# Altium project EMG-Arm-ELEC-V2.0.PrjPcb (part 1 of 4)
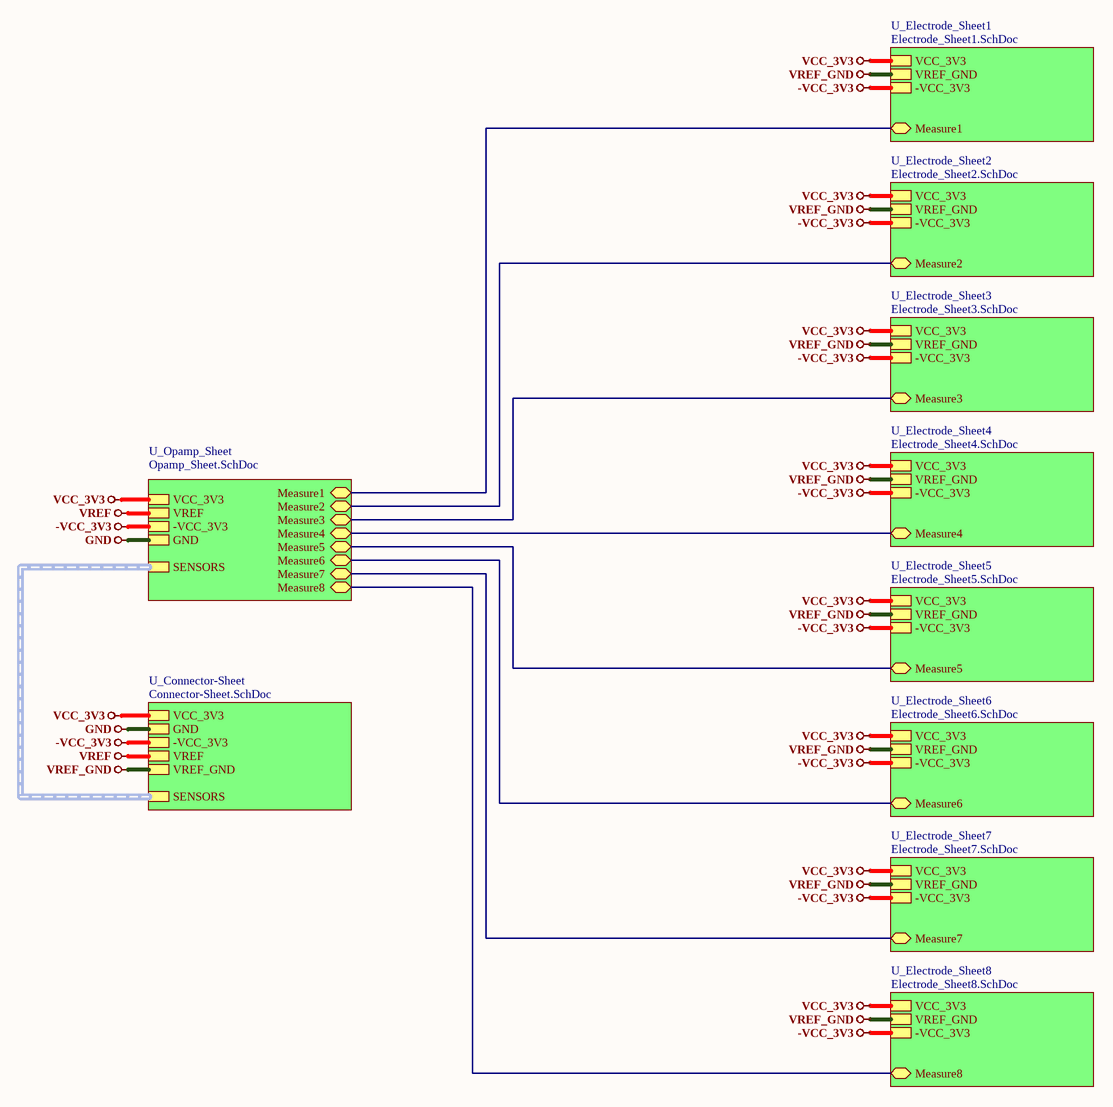
[diagram p0: Top-Sheet.SchDoc]
11 sheets, 263 parts. Net scope: hierarchical (ports join the sheet entries above them; power ports are global).
Board file: EMG-Arm-ELEC-V2.0.PcbDoc
Sheets:
  Top-Sheet.SchDoc
    U_Opamp_Sheet = Opamp_Sheet.SchDoc
    U_Connector-Sheet = Connector-Sheet.SchDoc
    U_Electrode_Sheet1 = Electrode_Sheet1.SchDoc
    U_Electrode_Sheet2 = Electrode_Sheet2.SchDoc
    U_Electrode_Sheet3 = Electrode_Sheet3.SchDoc
    U_Electrode_Sheet4 = Electrode_Sheet4.SchDoc
    U_Electrode_Sheet5 = Electrode_Sheet5.SchDoc
    U_Electrode_Sheet6 = Electrode_Sheet6.SchDoc
    U_Electrode_Sheet7 = Electrode_Sheet7.SchDoc
    U_Electrode_Sheet8 = Electrode_Sheet8.SchDoc

## Sheet Top-Sheet.SchDoc
size 420 x 297 mm

### Sub-sheets
U_Connector-Sheet = Connector-Sheet.SchDoc: SENSORS (harness SENSORS), -VCC_3V3, VCC_3V3, GND, VREF, VREF_GND
U_Electrode_Sheet1 = Electrode_Sheet1.SchDoc: -VCC_3V3, VREF_GND, VCC_3V3, Measure1 (bidir)
U_Electrode_Sheet2 = Electrode_Sheet2.SchDoc: -VCC_3V3, VREF_GND, VCC_3V3, Measure2 (bidir)
U_Electrode_Sheet3 = Electrode_Sheet3.SchDoc: -VCC_3V3, VREF_GND, VCC_3V3, Measure3 (bidir)
U_Electrode_Sheet4 = Electrode_Sheet4.SchDoc: -VCC_3V3, VREF_GND, VCC_3V3, Measure4 (bidir)
U_Electrode_Sheet5 = Electrode_Sheet5.SchDoc: -VCC_3V3, VREF_GND, VCC_3V3, Measure5 (bidir)
U_Electrode_Sheet6 = Electrode_Sheet6.SchDoc: -VCC_3V3, VREF_GND, VCC_3V3, Measure6 (bidir)
U_Electrode_Sheet7 = Electrode_Sheet7.SchDoc: -VCC_3V3, VREF_GND, VCC_3V3, Measure7 (bidir)
U_Electrode_Sheet8 = Electrode_Sheet8.SchDoc: -VCC_3V3, VREF_GND, VCC_3V3, Measure8 (bidir)
U_Opamp_Sheet = Opamp_Sheet.SchDoc: SENSORS (harness SENSORS), -VCC_3V3, VREF, VCC_3V3, GND, Measure1 (bidir), Measure2 (bidir), Measure3 (bidir), Measure4 (bidir), Measure5 (bidir), Measure6 (bidir), Measure7 (bidir), Measure8 (bidir)

### Nets
-VCC_3V3: sheet U_Opamp_Sheet/-VCC_3V3, sheet U_Connector-Sheet/-VCC_3V3, sheet U_Electrode_Sheet1/-VCC_3V3, sheet U_Electrode_Sheet2/-VCC_3V3, sheet U_Electrode_Sheet3/-VCC_3V3, sheet U_Electrode_Sheet4/-VCC_3V3, sheet U_Electrode_Sheet5/-VCC_3V3, sheet U_Electrode_Sheet6/-VCC_3V3, sheet U_Electrode_Sheet7/-VCC_3V3, sheet U_Electrode_Sheet8/-VCC_3V3
GND: sheet U_Opamp_Sheet/GND, sheet U_Connector-Sheet/GND
VCC_3V3: sheet U_Opamp_Sheet/VCC_3V3, sheet U_Connector-Sheet/VCC_3V3, sheet U_Electrode_Sheet1/VCC_3V3, sheet U_Electrode_Sheet2/VCC_3V3, sheet U_Electrode_Sheet3/VCC_3V3, sheet U_Electrode_Sheet4/VCC_3V3, sheet U_Electrode_Sheet5/VCC_3V3, sheet U_Electrode_Sheet6/VCC_3V3, sheet U_Electrode_Sheet7/VCC_3V3, sheet U_Electrode_Sheet8/VCC_3V3
VREF: sheet U_Opamp_Sheet/VREF, sheet U_Connector-Sheet/VREF
VREF_GND: sheet U_Connector-Sheet/VREF_GND, sheet U_Electrode_Sheet1/VREF_GND, sheet U_Electrode_Sheet2/VREF_GND, sheet U_Electrode_Sheet3/VREF_GND, sheet U_Electrode_Sheet4/VREF_GND, sheet U_Electrode_Sheet5/VREF_GND, sheet U_Electrode_Sheet6/VREF_GND, sheet U_Electrode_Sheet7/VREF_GND, sheet U_Electrode_Sheet8/VREF_GND
Measure1: sheet U_Opamp_Sheet/Measure1, sheet U_Electrode_Sheet1/Measure1
Measure2: sheet U_Opamp_Sheet/Measure2, sheet U_Electrode_Sheet2/Measure2
Measure3: sheet U_Opamp_Sheet/Measure3, sheet U_Electrode_Sheet3/Measure3
Measure4: sheet U_Opamp_Sheet/Measure4, sheet U_Electrode_Sheet4/Measure4
Measure5: sheet U_Opamp_Sheet/Measure5, sheet U_Electrode_Sheet5/Measure5
Measure6: sheet U_Opamp_Sheet/Measure6, sheet U_Electrode_Sheet6/Measure6
Measure7: sheet U_Opamp_Sheet/Measure7, sheet U_Electrode_Sheet7/Measure7
Measure8: sheet U_Opamp_Sheet/Measure8, sheet U_Electrode_Sheet8/Measure8

### Buses and harness runs
harness sheet U_Connector-Sheet/SENSORS = sheet U_Opamp_Sheet/SENSORS

### Notes on the sheet
- File:
- Title:
- Date:
- Page
- Num:
- Total:
- Drawn By: Huzaifa Ali

## Sheet Opamp_Sheet.SchDoc
size 420 x 297 mm
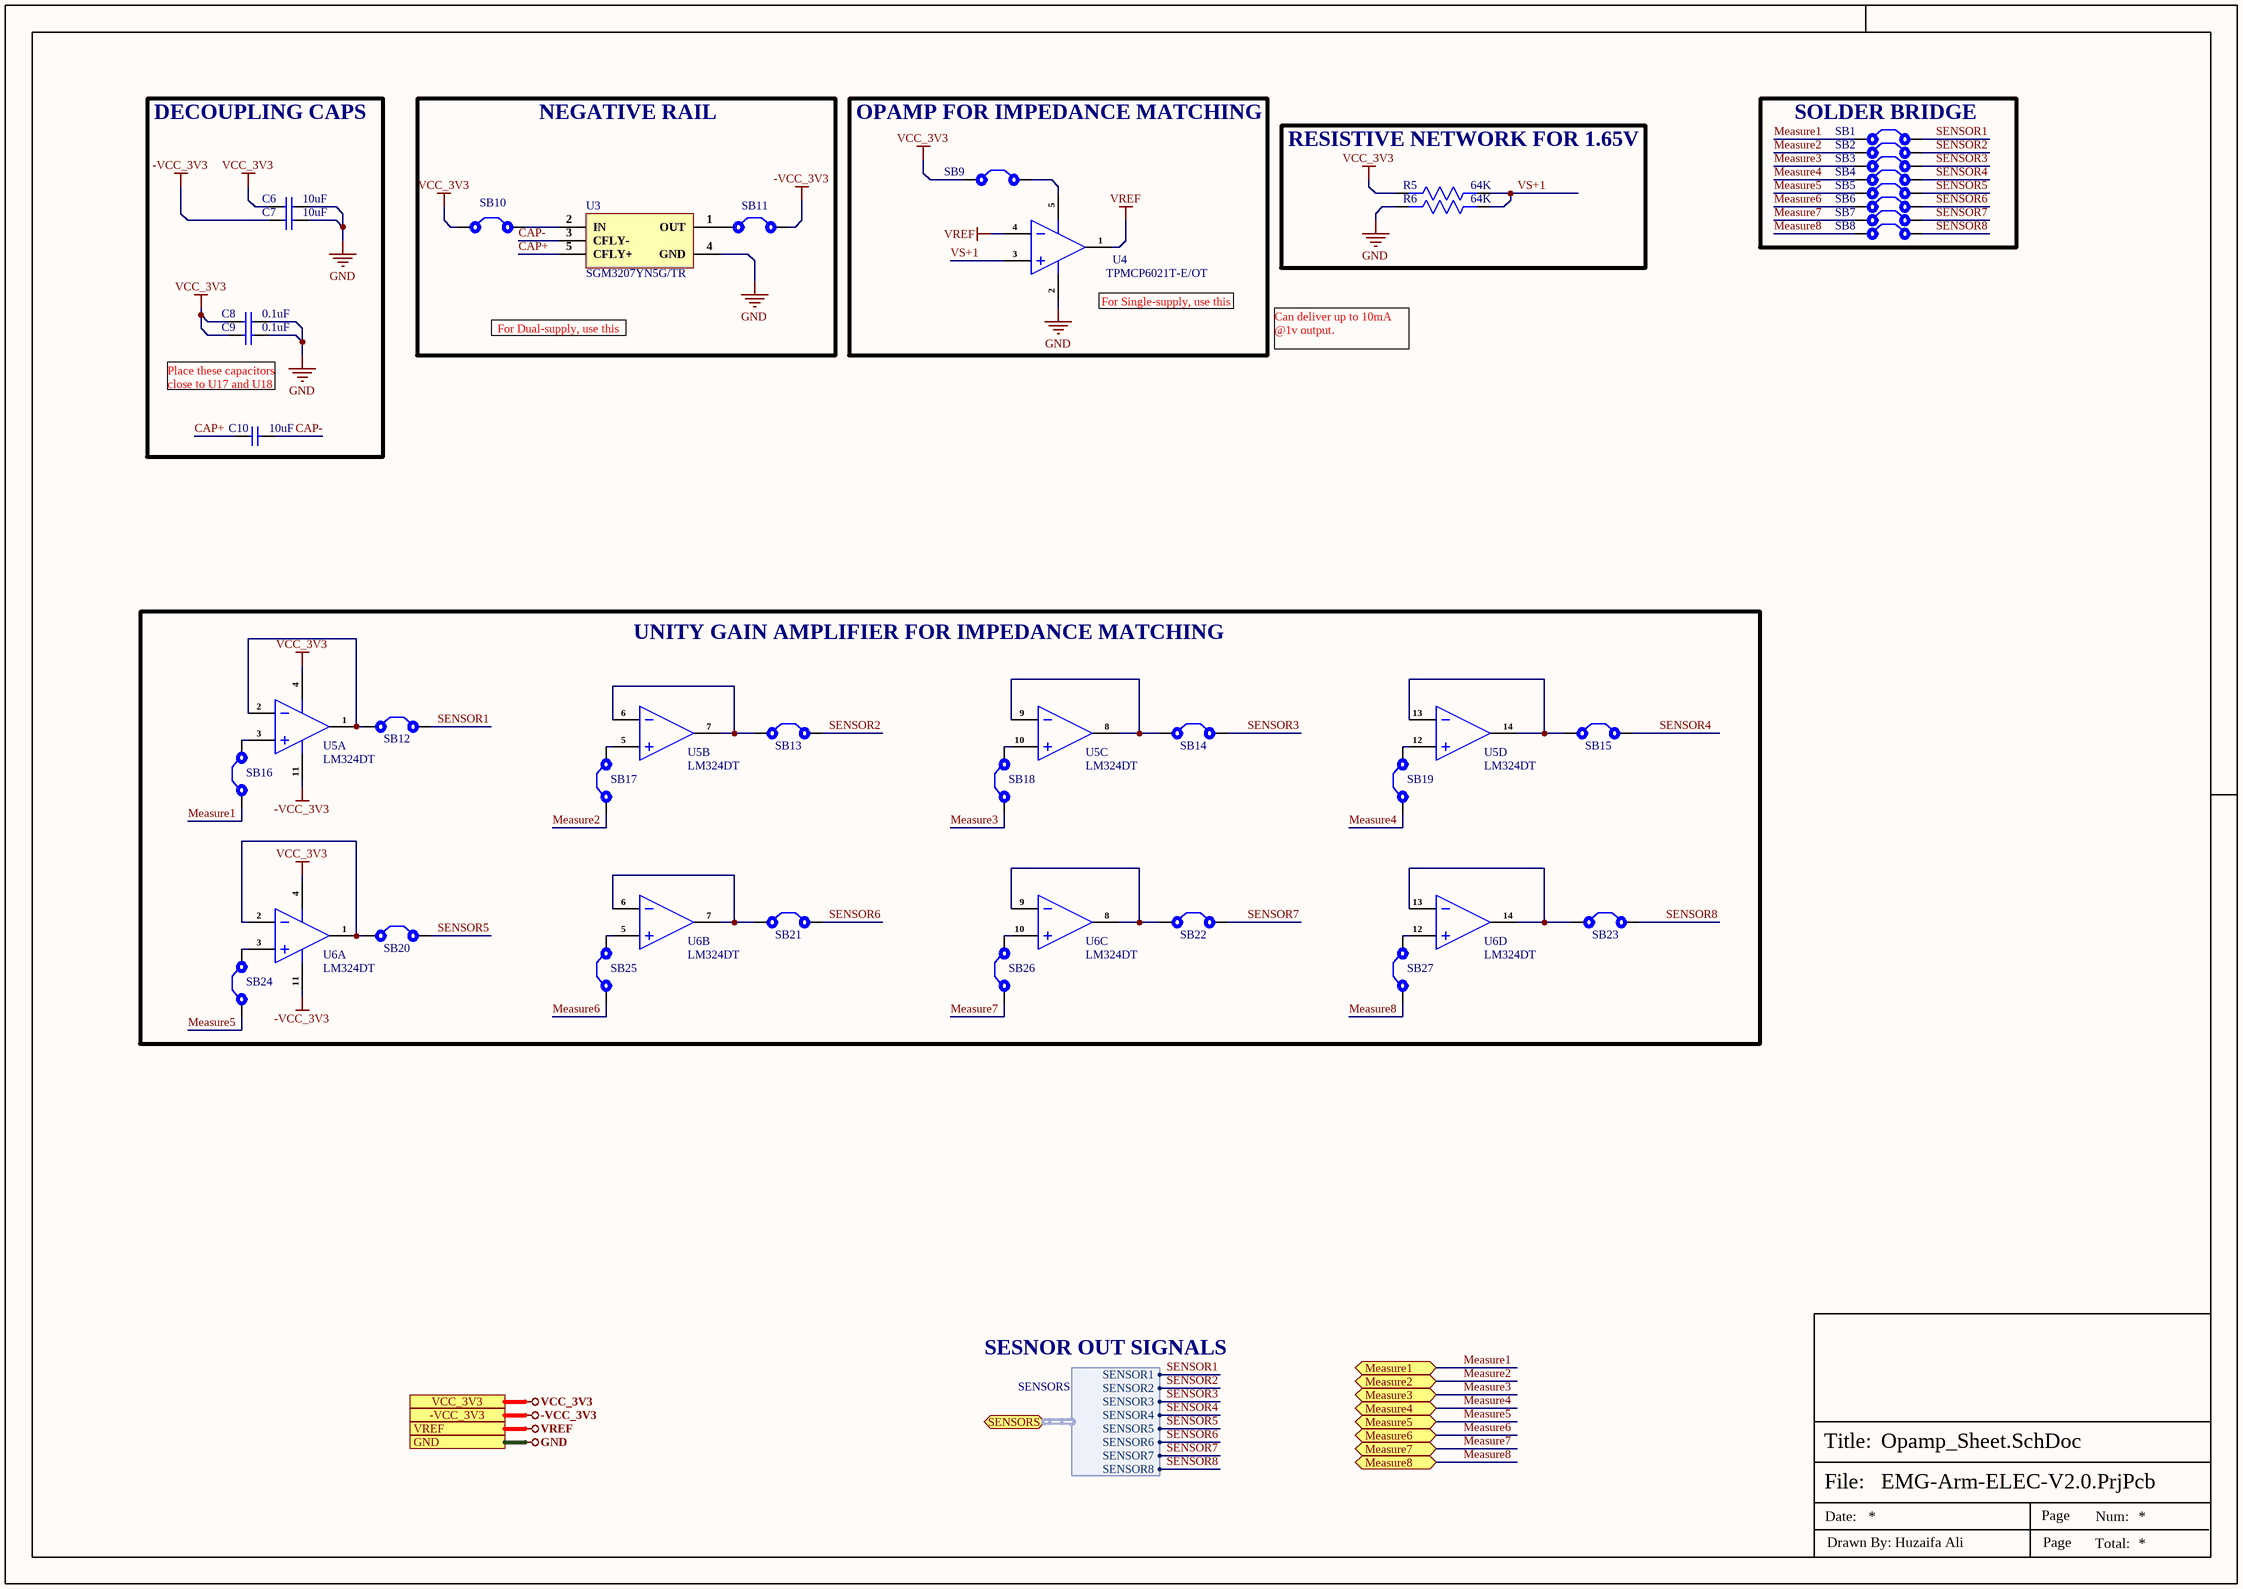
[diagram p1: Opamp_Sheet.SchDoc]

### Parts
C6  10uF  [Cap-0603]
C7  10uF  [Cap-0603]
C8  0.1uF  [Cap-0402]
C9  0.1uF  [Cap-0402]
C10  10uF  [Cap-0603]
R5  64K  [Res-0603]
R6  64K  [Res-0603]
SB1  Solder Bridge 0402  [Solder Bridge 0402]  (value not drawn)  (no BOM)
SB2  Solder Bridge 0402  [Solder Bridge 0402]  (value not drawn)  (no BOM)
SB3  Solder Bridge 0402  [Solder Bridge 0402]  (value not drawn)  (no BOM)
SB4  Solder Bridge 0402  [Solder Bridge 0402]  (value not drawn)  (no BOM)
SB5  Solder Bridge 0402  [Solder Bridge 0402]  (value not drawn)  (no BOM)
SB6  Solder Bridge 0402  [Solder Bridge 0402]  (value not drawn)  (no BOM)
SB7  Solder Bridge 0402  [Solder Bridge 0402]  (value not drawn)  (no BOM)
SB8  Solder Bridge 0402  [Solder Bridge 0402]  (value not drawn)  (no BOM)
SB9  Solder Bridge 0402  [Solder Bridge 0402]  (value not drawn)  (no BOM)
SB10  Solder Bridge 0402  [Solder Bridge 0402]  (value not drawn)  (no BOM)
SB11  Solder Bridge 0402  [Solder Bridge 0402]  (value not drawn)  (no BOM)
SB12  Solder Bridge 0402  [Solder Bridge 0402]  (value not drawn)  (no BOM)
SB13  Solder Bridge 0402  [Solder Bridge 0402]  (value not drawn)  (no BOM)
SB14  Solder Bridge 0402  [Solder Bridge 0402]  (value not drawn)  (no BOM)
SB15  Solder Bridge 0402  [Solder Bridge 0402]  (value not drawn)  (no BOM)
SB16  Solder Bridge 0402  [Solder Bridge 0402]  (value not drawn)  (no BOM)
SB17  Solder Bridge 0402  [Solder Bridge 0402]  (value not drawn)  (no BOM)
SB18  Solder Bridge 0402  [Solder Bridge 0402]  (value not drawn)  (no BOM)
SB19  Solder Bridge 0402  [Solder Bridge 0402]  (value not drawn)  (no BOM)
SB20  Solder Bridge 0402  [Solder Bridge 0402]  (value not drawn)  (no BOM)
SB21  Solder Bridge 0402  [Solder Bridge 0402]  (value not drawn)  (no BOM)
SB22  Solder Bridge 0402  [Solder Bridge 0402]  (value not drawn)  (no BOM)
SB23  Solder Bridge 0402  [Solder Bridge 0402]  (value not drawn)  (no BOM)
SB24  Solder Bridge 0402  [Solder Bridge 0402]  (value not drawn)  (no BOM)
SB25  Solder Bridge 0402  [Solder Bridge 0402]  (value not drawn)  (no BOM)
SB26  Solder Bridge 0402  [Solder Bridge 0402]  (value not drawn)  (no BOM)
SB27  Solder Bridge 0402  [Solder Bridge 0402]  (value not drawn)  (no BOM)
U3  SGM3207YN5G/TR  [SOT-23-5]
U4  TPMCP6021T-E/OT  [SOT-23-5]
U5  LM324DT  [14-SO]  (parts A,B,C,D of 4)
U6  LM324DT  [14-SO]  (parts A,B,C,D of 4)

### Blocks framed on the sheet
DECOUPLING CAPS: C6-C10
NEGATIVE RAIL: SB10 SB11 U3
OPAMP FOR IMPEDANCE MATCHING: SB9 U4
SOLDER BRIDGE: SB1-SB8
RESISTIVE NETWORK FOR 1.65V: R5 R6
UNITY GAIN AMPLIFIER FOR IMPEDANCE MATCHING: SB12-SB27 U5 U6

### Ports
-VCC_3V3, GND, Measure1 (bidir), Measure2 (bidir), Measure3 (bidir), Measure4 (bidir), Measure5 (bidir), Measure6 (bidir), Measure7 (bidir), Measure8 (bidir), SENSORS (bidir, harness SENSORS), VCC_3V3, VREF

### Harnesses
SENSORS: SENSOR1, SENSOR2, SENSOR3, SENSOR4, SENSOR5, SENSOR6, SENSOR7, SENSOR8

### Nets
-VCC_3V3: C7.1 SB11.2 U5.11(VCC-) U6.11(VCC-) ; port -VCC_3V3
GND: C6.2 C7.2 C8.2 C9.2 R6.2 U3.4(GND) U4.2(V-) ; port GND
VCC_3V3: C6.1 C8.1 C9.1 R5.2 SB9.1 SB10.1 U5.4(VCC+) U6.4(VCC+) ; port VCC_3V3
VREF: U4.1(OUT) U4.4(IN-) ; port VREF
CAP+: C10.1 U3.5(CFLY+)
CAP-: C10.2 U3.3(CFLY-)
Measure1: SB1.1 SB16.1 ; port Measure1
Measure2: SB2.1 SB17.1 ; port Measure2
Measure3: SB3.1 SB18.1 ; port Measure3
Measure4: SB4.1 SB19.1 ; port Measure4
Measure5: SB5.1 SB24.1 ; port Measure5
Measure6: SB6.1 SB25.1 ; port Measure6
Measure7: SB7.1 SB26.1 ; port Measure7
Measure8: SB8.1 SB27.1 ; port Measure8
SENSOR1: SB1.2 SB12.2 ; port SENSORS.SENSOR1
SENSOR2: SB2.2 SB13.2 ; port SENSORS.SENSOR2
SENSOR3: SB3.2 SB14.2 ; port SENSORS.SENSOR3
SENSOR4: SB4.2 SB15.2 ; port SENSORS.SENSOR4
SENSOR5: SB5.2 SB20.2 ; port SENSORS.SENSOR5
SENSOR6: SB6.2 SB21.2 ; port SENSORS.SENSOR6
SENSOR7: SB7.2 SB22.2 ; port SENSORS.SENSOR7
SENSOR8: SB8.2 SB23.2 ; port SENSORS.SENSOR8
VS+1: R5.1 R6.1 U4.3(IN+)
NetSB9_2: SB9.2 U4.5(V+)
NetSB10_2: SB10.2 U3.2(IN)
NetSB11_1: SB11.1 U3.1(OUT)
NetSB12_1: SB12.1 U5.1(1OUT) U5.2(IN-)
NetSB13_1: SB13.1 U5.6(2IN-) U5.7(2OUT)
NetSB14_1: SB14.1 U5.8(3OUT) U5.9(3IN-)
NetSB15_1: SB15.1 U5.13(4IN-) U5.14(4OUT)
NetSB16_2: SB16.2 U5.3(IN+)
NetSB17_2: SB17.2 U5.5(2IN+)
NetSB18_2: SB18.2 U5.10(3IN+)
NetSB19_2: SB19.2 U5.12(4IN+)
NetSB20_1: SB20.1 U6.1(1OUT) U6.2(IN-)
NetSB21_1: SB21.1 U6.6(2IN-) U6.7(2OUT)
NetSB22_1: SB22.1 U6.8(3OUT) U6.9(3IN-)
NetSB23_1: SB23.1 U6.13(4IN-) U6.14(4OUT)
NetSB24_2: SB24.2 U6.3(IN+)
NetSB25_2: SB25.2 U6.5(2IN+)
NetSB26_2: SB26.2 U6.10(3IN+)
NetSB27_2: SB27.2 U6.12(4IN+)

### Notes on the sheet
- (near U4) For Single-supply, use this
- Place these capacitors close to U17 and U18
- For Dual-supply, use this
- Can deliver up to 10mA @1v output.
- SESNOR OUT SIGNALS
- File:
- Title:
- Date:
- Page
- Num:
- Total:
- Drawn By: Huzaifa Ali

### Library data of the parts
C6 C7 C10 = CL10A106MA8NRNC: CAP CER 10UF 25V X5R 0603; Manufacturer: Samsung; Tolerance: 20%; Supplier 1: Avnet; Manufacturer Part Number: CL10A106MA8NRNC; RoHS: Yes; Category: Ceramic Capacitors; Pricing 1: 4000=0.03753, 8000=0.03700, 16000=0.03595, 24000=0.03515, 32000=0.03383, 40000=0.03304, 400000=0.03225 (USD); Mount: Surface Mount; Case/Package: 0603; Case Code (Metric): 1608; Case Code (Imperial): 0603; Contact Plating: Tin; Min Operating Temperature: -55°C; Max Operating Temperature: 85°C; Package Quantity: 1; Packaging: Tape and Reel; Capacitance: 10uF; Voltage Rating: 25V; Dielectric: X5R; Termination: Wraparound; Series: CL; Construction: Flat; Length: 0.063inch; Width: 0.031inch; Thickness: 0.035inch; Lead Free: Lead Free; RoHS Compliant: Yes; ComponentLink1URL: https://datasheet.ciiva.com/25766/cl10a106ma8nrnc-25766562.pdf?src-supplier=Digi-Key; ComponentLink1Description: https://datasheet.ciiva.com/25766/cl10a106ma8nrnc-25766562.pdf?src-supplier=Digi-Key; Supplier Part Number 1: CL10A106MA8NRNC; LCSC Part Number: C96446
C8 C9 = GRM155R71H104ME14D: CAP CER 0.1UF 50V X7R 0402; Manufacturer: Murata; Tolerance: 20%; Capacitance: 100nF; Item Type: Capacitor; Supplier 1: Avnet; Manufacturer Part Number: GRM155R71H104ME14D; Stock 1: 100000; Pricing 1: 10000=0.00444, 20000=0.00420, 40000=0.00396, 60000=0.00372, 80000=0.00348, 100000=0.00324, 1000000=0.00300 (USD); Mount: Surface Mount; Case/Package: 0402; Min Operating Temperature: -55°C; Max Operating Temperature: 125°C; Packaging: Cut Tape; Voltage Rating: 50V; Length: 0.039inch; Width: 0.02inch; Thickness: 0.022inch; ComponentLink1URL: http://www.mouser.com/ds/2/281/c02e-2905.pdf?src-supplier=Mouser; ComponentLink1Description: http://www.mouser.com/ds/2/281/c02e-2905.pdf?src-supplier=Mouser; ComponentLink2URL: http://search.murata.co.jp/Ceramy/image/img/A01X/G101/ENG/GRM155R71H104ME14-01.pdf?src-supplier=Digi-Key; ComponentLink2Description: http://search.murata.co.jp/Ceramy/image/img/A01X/G101/ENG/GRM155R71H104ME14-01.pdf?src-supplier=Digi-Key; ComponentLink3URL: http://psearch.en.murata.com/capacitor/product/GRM155R71H104ME14%23.pdf?src-supplier=Avnet; ComponentLink3Description: http://psearch.en.murata.com/capacitor/product/GRM155R71H104ME14%23.pdf?src-supplier=Avnet; Supplier Part Number 1: GRM155R71H104ME14D; RoHS: Yes; Category: Ceramic Capacitors; RoHS Compliant: Yes; LCSC Part Number: C182412
R5 R6 = ARG03DTC6402N: 1/10W Thin Film Resistor 75V ±0.5% ±25ppm/℃ -55℃~+155℃ 64kΩ 0603 Chip Resistor - Surface Mount ROHS; Manufacturer: iking Tech; Value: 64K; Manufacturer Part Number: ARG03DTC6402N; Footprint: 0603; ComponentLink1Description: LCSC; ComponentLink1URL: https://lcsc.com/product-detail/Chip-Resistor-Surface-Mount_Viking-Tech-ARG03DTC6402N_C2902643.html; LCSC Part Number: C2902643; Item Type: Resistor
SB1-SB27 = Solder Bridge 0402: Solder Bridge ON; Manufacturer Part Number: Solder Bridge 0402; Item Type: Solder Bridge
U3 = SGM3207YN5G/TR: NO Charge pump 1 -5.5V~-1.4V 1.4V~5.5V 60mA 19kHz SOT-23-5 DC-DC Converters ROHS; Manufacturer: SG Micro; Item Type: IC; Supplier 1: Avnet; Manufacturer Part Number: SGM3207YN5G/TR; RoHS: No; Category: Uncategorized; Pricing 1: 3000=0.38750, 6000=0.36250, 12000=0.33750, 18000=0.32500, 24000=0.31250, 30000=0.31250, 300000=0.30500 (USD); LCSC Part Number: C80403; Supplier Part Number 1: SGM3207YN5G/TR
U4 = TPMCP6021T-E/OT: SOT-23-5 Operational Amplifier ROHS; Manufacturer: TECH PUBLIC; Item Type: IC; Manufacturer Part Number: TPMCP6021T-E/OT; LCSC Part Number: C2923365; ComponentLink1Description: LCSC; ComponentLink1URL: https://www.lcsc.com/product-detail/Operational-Amplifier_TECH-PUBLIC-TPMCP6021T-E-OT_C2923365.html
U5 U6 = LM324DT: IC OPAMP GP 1.3MHZ 14SO; Manufacturer: STMicroelectronics; Max Supply Voltage: 30V; Min Supply Voltage: 3V; Min Dual Supply Voltage: 1.5V; Max Dual Supply Voltage: 15V; Voltage Gain: 100dB; Slew Rate: 0.4V/µs; Common Mode Rejection Ratio: 70dB; Nominal Supply Current: 1.2mA; Input Offset Voltage (Vos): 7mV; Input Bias Current: 150nA; Number of Circuits: 4; Output Current per Channel: 40mA; Dual Supply Voltage: 12V; Supply Type: Single,Dual; Input Voltage Noise Density: 40nV/sqrt Hz; Max Power Dissipation: 400mW; Supplier 1: Arrow Electronics; Manufacturer Part Number: LM324DT; RoHS: Yes; LCSC Part Number: C71035; Stock 1: 287500; Pricing 1: 2500=0.18900 (USD); Mount: Surface Mount; Case/Package: SO; Number of Pins: 14; Contact Plating: Tin,Matte; Weight: 0.009143oz; Min Operating Temperature: 0°C; Max Operating Temperature: 70°C; Gain Bandwidth Product: 1.3MHz; Packaging: Cut Tape; Package Quantity: 2500; Operating Supply Current: 1.2mA; Operating Supply Voltage: 15V; Number of Channels: 4; Output Current: 40mA; Number of Elements: 4; Series: LM324; Technology: BIPOLAR; Bandwidth: 1.3MHz; Number of Amplifiers: 4; Unity Gain Bandwidth Product: 1.3MHz; Item Type: IC; Width: 4mm; Height: 1.65mm; Radiation Hardening: No; RoHS Compliant: Yes; Lead Free: Lead Free; REACH SVHC: No SVHC; ComponentLink1URL: https://datasheet.ciiva.com/4758/cd00000457-103203-4758032.pdf?src-supplier=Mouser; ComponentLink1Description: https://datasheet.ciiva.com/4758/cd00000457-103203-4758032.pdf?src-supplier=Mouser; ComponentLink2URL: https://datasheet.ciiva.com/8008/1834360-8008827.pdf?src-supplier=Element14; ComponentLink2Description: https://datasheet.ciiva.com/8008/1834360-8008827.pdf?src-supplier=Element14; ComponentLink3URL: https://datasheet.ciiva.com/8008/1834360-8008490.pdf?src-supplier=Element14; ComponentLink3Description: https://datasheet.ciiva.com/8008/1834360-8008490.pdf?src-supplier=Element14; ComponentLink4URL: https://datasheet.ciiva.com/28630/1834360-28630538.pdf?src-supplier=Element14; ComponentLink4Description: https://datasheet.ciiva.com/28630/1834360-28630538.pdf?src-supplier=Element14; ComponentLink5URL: https://datasheet.ciiva.com/1795/cd00000457-1795560.pdf?src-supplier=Digi-Key; ComponentLink5Description: https://datasheet.ciiva.com/1795/cd00000457-1795560.pdf?src-supplier=Digi-Key; ComponentLink6URL: https://datasheet.ciiva.com/1795/cd00000457-1795559.pdf?src-supplier=Digi-Key; ComponentLink6Description: https://datasheet.ciiva.com/1795/cd00000457-1795559.pdf?src-supplier=Digi-Key; ComponentLink7URL: https://datasheet.ciiva.com/1795/cd00000457-1795561.pdf?src-supplier=Digi-Key; ComponentLink7Description: https://datasheet.ciiva.com/1795/cd00000457-1795561.pdf?src-supplier=Digi-Key; ComponentLink8URL: https://datasheet.ciiva.com/16375/cd00000457-16375528.pdf?src-supplier=Future+Electronics; ComponentLink8Description: https://datasheet.ciiva.com/16375/cd00000457-16375528.pdf?src-supplier=Future+Electronics; Supplier Part Number 1: LM324DT

## Sheet Connector-Sheet.SchDoc
size 420 x 297 mm
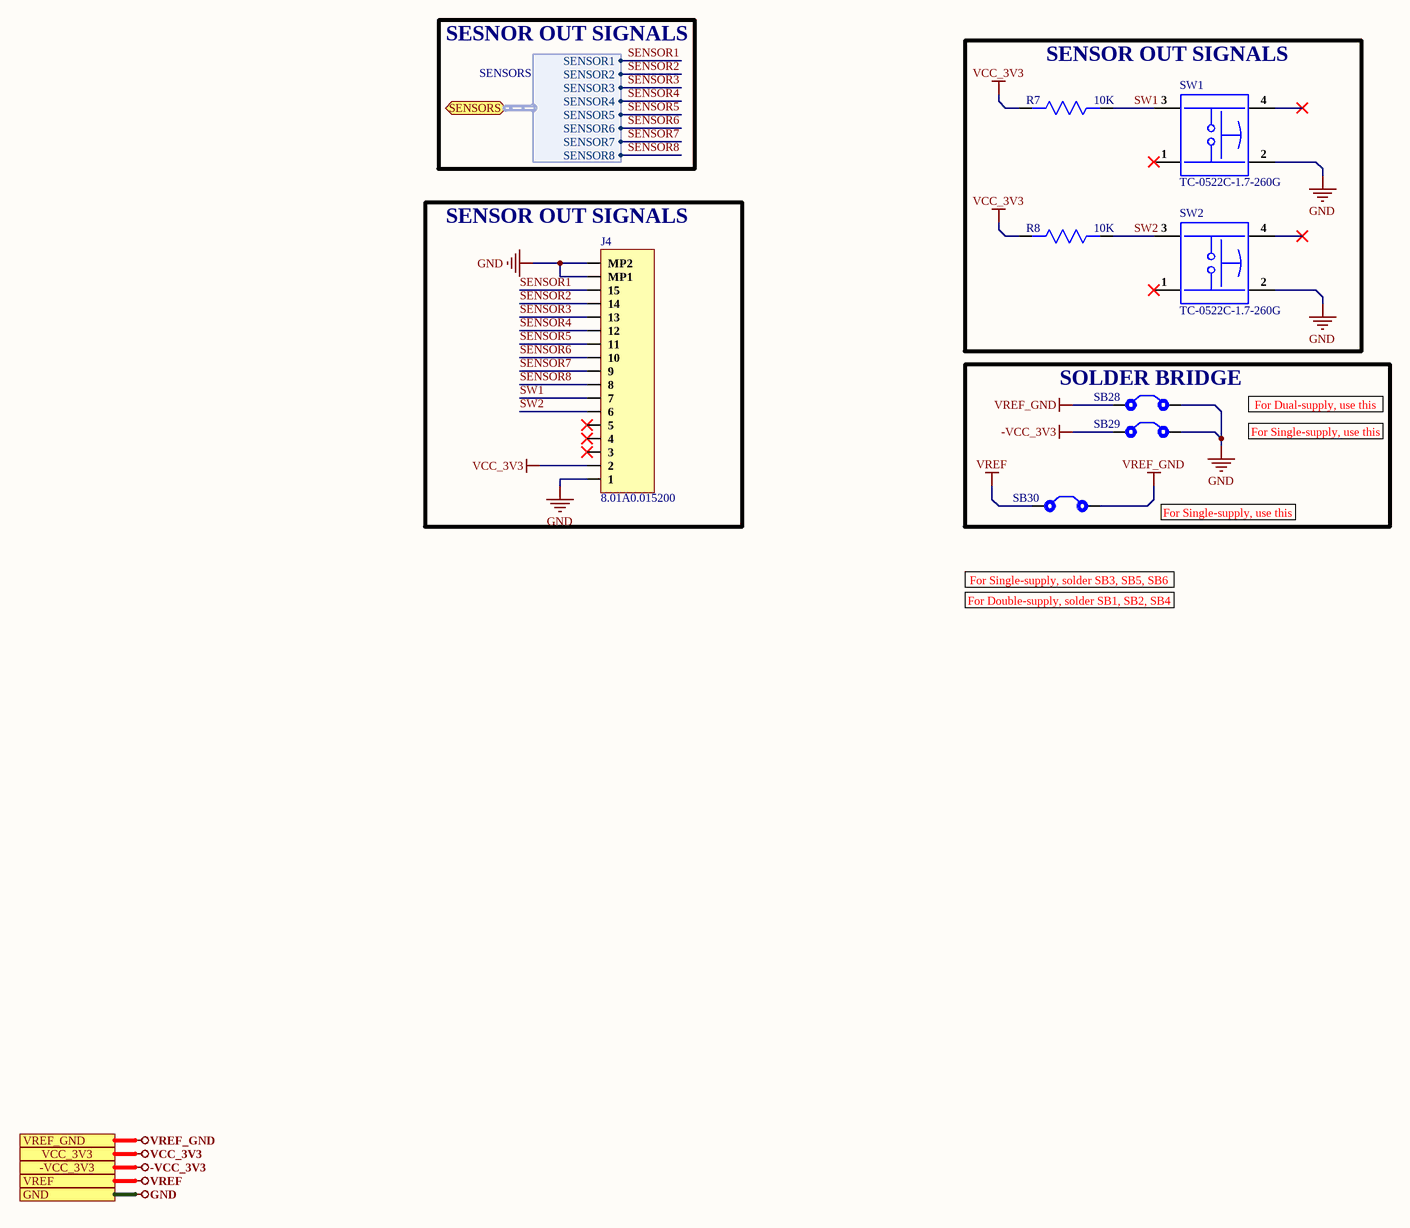
[diagram p2: Connector-Sheet.SchDoc]

### Parts
J4  8.01A0.015200  [8.01A0.015200]
R7  10K  [Res-0402]
R8  10K  [Res-0402]
SB28  Solder Bridge 0402  [Solder Bridge 0402]  (value not drawn)  (no BOM)
SB29  Solder Bridge 0402  [Solder Bridge 0402]  (value not drawn)  (no BOM)
SB30  Solder Bridge 0402  [Solder Bridge 0402]  (value not drawn)  (no BOM)
SW1  TC-0522C-1.7-260G  [TC-0522C-1.7-260G_]
SW2  TC-0522C-1.7-260G  [TC-0522C-1.7-260G_]

### Blocks framed on the sheet
SENSOR OUT SIGNALS: R7 R8 SW1 SW2
SENSOR OUT SIGNALS: J4
SOLDER BRIDGE: SB28-SB30

### Ports
-VCC_3V3, GND, SENSORS (bidir, harness SENSORS), VCC_3V3, VREF, VREF_GND

### Harnesses
SENSORS: SENSOR1, SENSOR2, SENSOR3, SENSOR4, SENSOR5, SENSOR6, SENSOR7, SENSOR8

### Nets
-VCC_3V3: SB29.1 ; port -VCC_3V3
GND: J4.1 J4.MP1 J4.MP2 SB28.2 SB29.2 SW1.2 SW2.2 ; port GND
VCC_3V3: J4.2 R7.2 R8.2 ; port VCC_3V3
VREF: SB30.1 ; port VREF
VREF_GND: SB28.1 SB30.2 ; port VREF_GND
SENSOR1: J4.15 ; port SENSORS.SENSOR1
SENSOR2: J4.14 ; port SENSORS.SENSOR2
SENSOR3: J4.13 ; port SENSORS.SENSOR3
SENSOR4: J4.12 ; port SENSORS.SENSOR4
SENSOR5: J4.11 ; port SENSORS.SENSOR5
SENSOR6: J4.10 ; port SENSORS.SENSOR6
SENSOR7: J4.9 ; port SENSORS.SENSOR7
SENSOR8: J4.8 ; port SENSORS.SENSOR8
SW1: J4.7 R7.1 SW1.3
SW2: J4.6 R8.1 SW2.3

Not connected (* = marked no-connect by the designer): J4 3* 4* 5*; SW1 1* 4*; SW2 1* 4*

### Notes on the sheet
- SESNOR OUT SIGNALS
- For Dual-supply, use this
- For Single-supply, use this
- For Single-supply, solder SB3, SB5, SB6
- For Double-supply, solder SB1, SB2, SB4
- File:
- Title:
- Date:
- Page
- Num:
- Total:
- Drawn By: Huzaifa Ali

### Library data of the parts
J4 = 8.01A0.015200: -40℃~+80℃ 15P Dual-sided contacts / top and bottom connection 0.5mm SMD,P=0.5mm,Surface Mount，Right Angle FFC, FPC (Flat Flexible) Connector Assemblies ROHS; Manufacturer: DIANWEI; Item Type: FFC, FPC Connector; Manufacturer Part Number: 8.01A0.015200; Package: SMD,P=0.5mm,Surface Mount，Right Angle; LCSC Part Number: C19188796; ComponentLink1Description: LCSC; ComponentLink1URL: https://www.lcsc.com/product-detail/FFC-FPC-Flat-Flexible-Connector-Assemblies_DIANWEI-8-01A0-015200_C19188796.html?s_z=n_HC-FPC-05-20-15RLTAG
R7 R8 = RC0402FR-0710KL: RES 10K OHM 1% 1/16W 0402; Manufacturer: Yageo; Resistance: 10kR; Temperature Coefficient: 100ppm/°C; Voltage Rating (DC): 50V; Power Rating: 62.5mW; Max Power Dissipation: 63mW; Supplier 1: Mouser; Manufacturer Part Number: RC0402FR-0710KL; Stock 1: 18648329; Pricing 1: 1=0.10000, 10=0.01400, 50=0.01400, 100=0.00500, 1000=0.00300, 10000=0.00200 (USD); Case/Package: 0402; Number of Pins: 2; Case Code (Imperial): 0402; Case Code (Metric): 1005; Min Operating Temperature: -55°C; Max Operating Temperature: 155°C; Tolerance: 1%; Packaging: Tape and Reel; Voltage Rating: 50V; Termination: SMD/SMT; Military Standard: Not; Working Voltage: 50V; Number of Terminations: 2; Length: 1mm; Height: 0.32mm; Width: 0.5mm; Depth: 0.5mm; Lead Pitch: 0.2mm; REACH SVHC: No SVHC; Lead Free: Lead Free; ComponentLink1URL: https://datasheet.ciiva.com/7660/38568-7660787.pdf?src-supplier=Element14; ComponentLink1Description: https://datasheet.ciiva.com/7660/38568-7660787.pdf?src-supplier=Element14; ComponentLink2URL: https://datasheet.ciiva.com/7849/1686128-7849814.pdf?src-supplier=Element14; ComponentLink2Description: https://datasheet.ciiva.com/7849/1686128-7849814.pdf?src-supplier=Element14; ComponentLink3URL: https://datasheet.ciiva.com/7983/1018594-7983486.pdf?src-supplier=Element14; ComponentLink3Description: https://datasheet.ciiva.com/7983/1018594-7983486.pdf?src-supplier=Element14; ComponentLink4URL: https://datasheet.ciiva.com/22747/1018594-22747512.pdf?src-supplier=Element14; ComponentLink4Description: https://datasheet.ciiva.com/22747/1018594-22747512.pdf?src-supplier=Element14; Supplier Part Number 1: 603-RC0402FR-0710KL; RoHS: Yes; Category: Chip SMD Resistors; Resistor Type: Thick Film; Features: Moisture Resistant; Series: RC; Resistance Tolerance: 1%; Construction: Rectangular; RoHS Compliant: Yes; ComponentLink5URL: https://datasheet.ciiva.com/12667/pyu-rc0402-51-rohs-l-6-r-12667067.pdf?src-supplier=Mouser; ComponentLink5Description: https://datasheet.ciiva.com/12667/pyu-rc0402-51-rohs-l-6-r-12667067.pdf?src-supplier=Mouser; ComponentLink6URL: https://datasheet.ciiva.com/7849/1784430-7849813.pdf?src-supplier=Element14; ComponentLink6Description: https://datasheet.ciiva.com/7849/1784430-7849813.pdf?src-supplier=Element14; ComponentLink7URL: https://datasheet.ciiva.com/7849/1784430-7849815.pdf?src-supplier=Element14; ComponentLink7Description: https://datasheet.ciiva.com/7849/1784430-7849815.pdf?src-supplier=Element14; LCSC Part Number: C60490
SB28-SB30 = Solder Bridge 0402: Solder Bridge ON; Manufacturer Part Number: Solder Bridge 0402; Item Type: Solder Bridge
SW1 SW2 = TC-0522C-1.7-260G: No Gull Wing 50mA 100MΩ 80000 260gf@±50gf 12V -25℃~+85℃ 1.7mm Golden Round Button Brick nogging SPST SMD Tactile Switches ROHS; Manufacturer: HCTL; Item Type: Switch; Manufacturer Part Number: TC-0522C-1.7-260G; Value: -; Footprint: Custom; ComponentLink1Description: LCSC; ComponentLink1URL: https://www.lcsc.com/product-detail/Tactile-Switches_HCTL-TC-0522C-1-7-260G_C2845290.html; LCSC Part Number: C2845290

## Sheet Electrode_Sheet1.SchDoc
size 420 x 297 mm
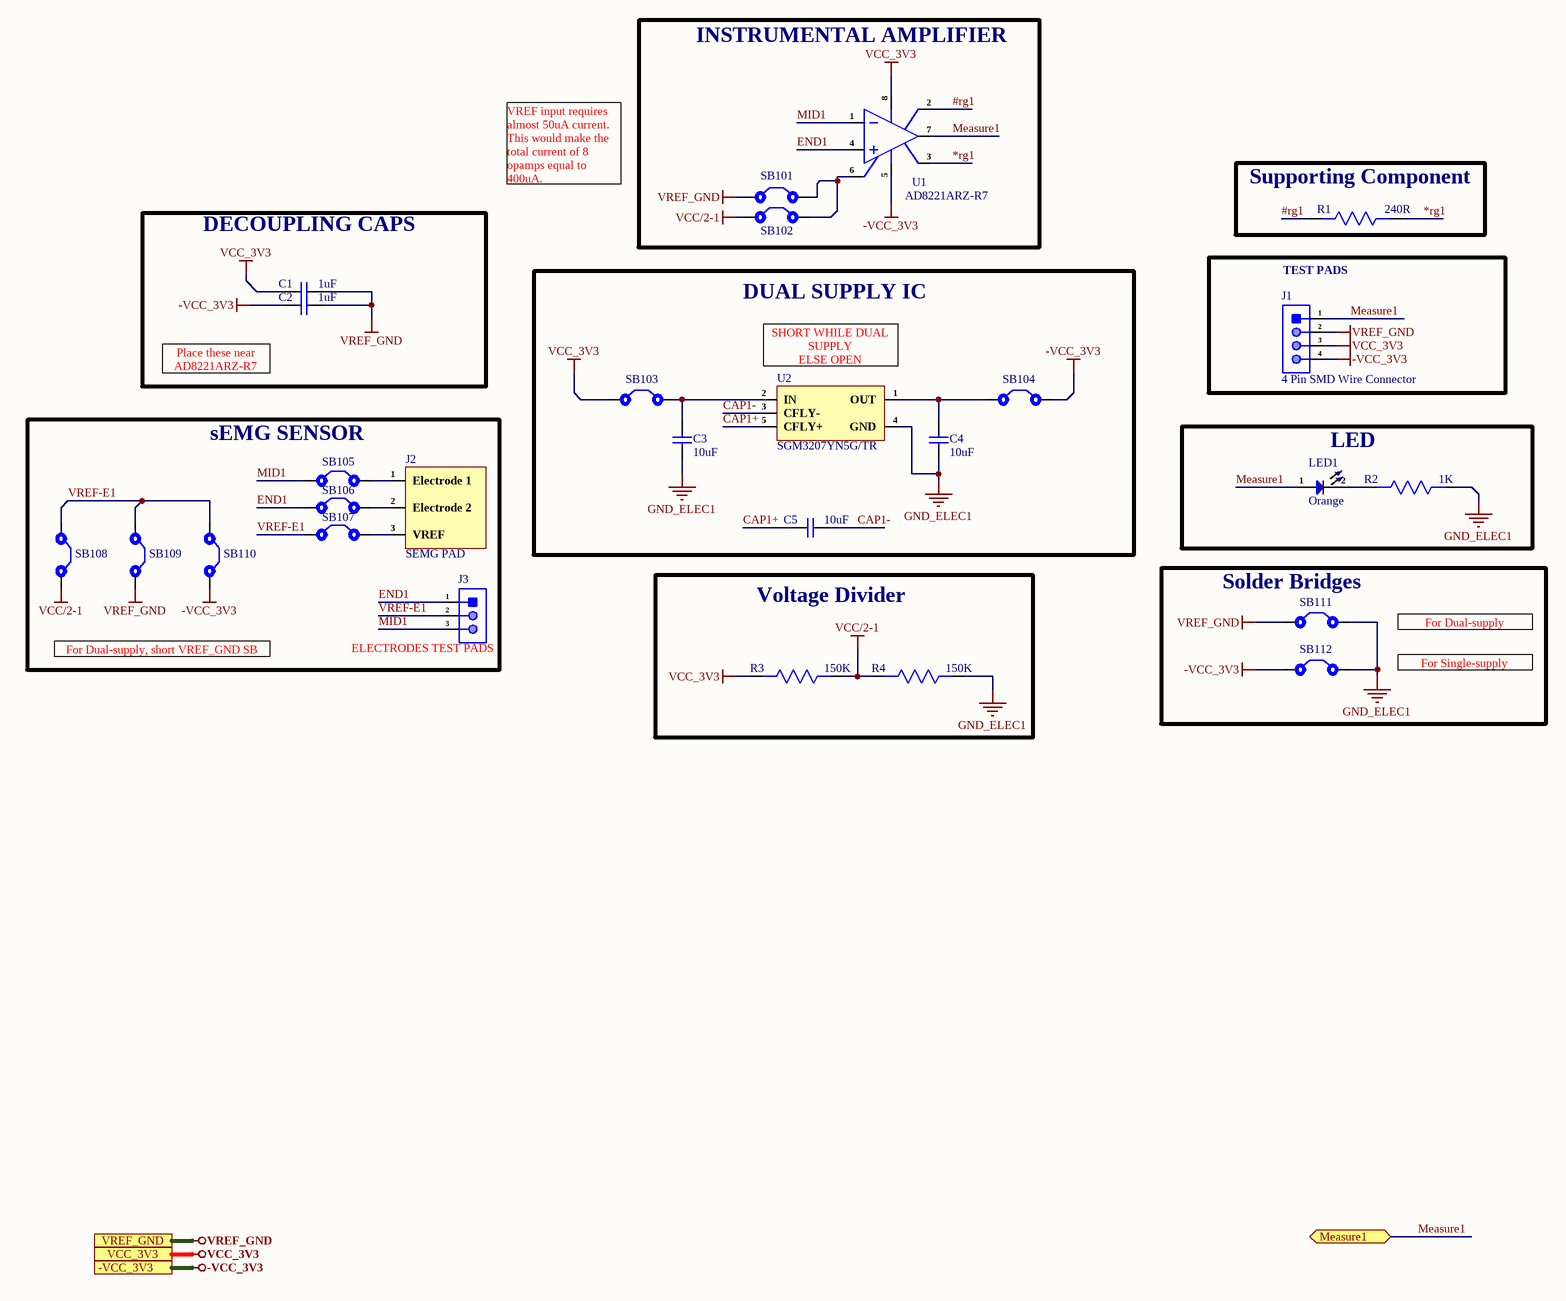
[diagram p3: Electrode_Sheet1.SchDoc]

### Parts
C1  1uF  [Cap-0402]
C2  1uF  [Cap-0402]
C3  10uF  [Cap-0603]
C4  10uF  [Cap-0603]
C5  10uF  [Cap-0603]
J1  4 Pin SMD Wire Connector  [4 Pin SMD Wire CON.]  (no BOM)
J2  SEMG PAD  [SEMG-PAD]
J3  Test Pad SMD 3 Pin  [Test Pad (SMD 3 Pin)]  (value not drawn)  (no BOM)
LED1  Orange  [LED-0603]
R1  240R  [Res-0402]
R2  1K  [Res-0402]
R3  150K  [Res-0402]
R4  150K  [Res-0402]
SB101  Solder Bridge 0402  [Solder Bridge 0402]  (value not drawn)  (no BOM)
SB102  Solder Bridge 0402  [Solder Bridge 0402]  (value not drawn)  (no BOM)
SB103  Solder Bridge 0402  [Solder Bridge 0402]  (value not drawn)  (no BOM)
SB104  Solder Bridge 0402  [Solder Bridge 0402]  (value not drawn)  (no BOM)
SB105  Solder Bridge 0402  [Solder Bridge 0402]  (value not drawn)  (no BOM)
SB106  Solder Bridge 0402  [Solder Bridge 0402]  (value not drawn)  (no BOM)
SB107  Solder Bridge 0402  [Solder Bridge 0402]  (value not drawn)  (no BOM)
SB108  Solder Bridge 0402  [Solder Bridge 0402]  (value not drawn)  (no BOM)
SB109  Solder Bridge 0402  [Solder Bridge 0402]  (value not drawn)  (no BOM)
SB110  Solder Bridge 0402  [Solder Bridge 0402]  (value not drawn)  (no BOM)
SB111  Solder Bridge 0402  [Solder Bridge 0402]  (value not drawn)  (no BOM)
SB112  Solder Bridge 0402  [Solder Bridge 0402]  (value not drawn)  (no BOM)
U1  AD8221ARZ-R7  [SOIC-8]
U2  SGM3207YN5G/TR  [SOT-23-5]

### Blocks framed on the sheet
INSTRUMENTAL AMPLIFIER: SB101 SB102 U1
Supporting Component: R1
DECOUPLING CAPS: C1 C2
TEST PADS: J1
DUAL SUPPLY IC: C3-C5 SB103 SB104 U2
sEMG SENSOR: J2 J3 SB105-SB110
LED: LED1 R2
Voltage Divider: R3 R4
Solder Bridges: SB111 SB112

### Ports
-VCC_3V3, Measure1 (bidir), VCC_3V3, VREF_GND

### Nets
-VCC_3V3: C2.1 J1.4 SB104.2 SB110.2 SB112.1 U1.5(V-) ; port -VCC_3V3
GND_ELEC1: C3.1 C4.1 R2.1 R4.2 SB111.2 SB112.2 U2.4(GND)
VCC/2-1: R3.2 R4.1 SB102.1 SB108.2
VCC_3V3: C1.1 J1.3 R3.1 SB103.1 U1.8(V+) ; port VCC_3V3
VREF_GND: C1.2 C2.2 J1.2 SB101.1 SB109.2 SB111.1 ; port VREF_GND
#rg1: R1.2 U1.2(RG)
*rg1: R1.1 U1.3(RG)
CAP1+: C5.1 U2.5(CFLY+)
CAP1-: C5.2 U2.3(CFLY-)
END1: J3.1 SB106.1 U1.4(IN+)
Measure1: J1.1 LED1.1 U1.7(VOUT) ; port Measure1
MID1: J3.3 SB105.1 U1.1(IN-)
VREF-E1: J3.2 SB107.1 SB108.1 SB109.1 SB110.1
NetC3_2: C3.2 SB103.2 U2.2(IN)
NetC4_2: C4.2 SB104.1 U2.1(OUT)
NetJ2_1: J2.1(Electrode_1) SB105.2
NetJ2_2: J2.2(Electrode_2) SB106.2
NetJ2_3: J2.3(VREF) SB107.2
NetLED1_2: LED1.2 R2.2
NetSB101_2: SB101.2 SB102.2 U1.6(REF)

### Notes on the sheet
- VREF input requires almost 50uA current. This would make the total current of 8 opamps equal to 400uA.
- Place these near AD8221ARZ-R7
- (near U2) SHORT WHILE DUAL SUPPLY
  ELSE OPEN
- For Dual-supply, short VREF_GND SB
- (near J3) ELECTRODES TEST PADS
- For Dual-supply
- For Single-supply
- File:
- Title:
- Date:
- Page
- Num:
- Total:
- Drawn By: Huzaifa Ali

### Library data of the parts
C1 C2 = CC0402KRX5R7BB105: CAP CER 1UF 16V X5R 0402; Manufacturer: Yageo; Tolerance: 10%; Item Type: Capacitor; Supplier 1: Digi-Key; Manufacturer Part Number: CC0402KRX5R7BB105; Stock 1: 1405667; Pricing 1: 1=0.36, 10=0.252, 100=0.1512, 500=0.1134, 1000=0.09576, 2500=0.09072, 5000=0.08568 (USD); Mount: Surface Mount; Case/Package: 0402; Weight: 2.3E-05oz; Case Code (Imperial): 0402; Case Code (Metric): 1005; Min Operating Temperature: -55°C; Max Operating Temperature: 85°C; Capacitance: 1uF; Dielectric: X5R; Packaging: Tape and Reel; Voltage Rating (DC): 16V; Voltage Rating: 16V; Termination: SMD/SMT; Composition: Ceramic; Length: 1mm; Height: 0.5mm; Width: 0.02inch; Thickness: 0.022inch; Depth: 0.5mm; Radiation Hardening: No; Lead Free: Lead Free; Halogen Free: Halogen Free; ComponentLink1URL: http://www.yageo.com/documents/recent/UPY-GPHC_X5R_4V-to-50V_12.pdf?src-supplier=Avnet+Europe; ComponentLink1Description: http://www.yageo.com/documents/recent/UPY-GPHC_X5R_4V-to-50V_12.pdf?src-supplier=Avnet+Europe; Supplier Part Number 1: 311-1691-6-ND; LCSC Part Number: C325464
C3-C5 = CL10A106MA8NRNC: as C6 on sheet Opamp_Sheet; Supplier 1: Avnet; Manufacturer Part Number: CL10A106MA8NRNC; RoHS: Yes; Category: Ceramic Capacitors; Pricing 1: 4000=0.03753, 8000=0.03700, 16000=0.03595, 24000=0.03515, 32000=0.03383, 40000=0.03304, 400000=0.03225 (USD); Mount: Surface Mount; Case/Package: 0603; Case Code (Metric): 1608; Case Code (Imperial): 0603; Contact Plating: Tin; Min Operating Temperature: -55°C; Max Operating Temperature: 85°C; Package Quantity: 1; Packaging: Tape and Reel; Capacitance: 10uF; Voltage Rating: 25V; Dielectric: X5R; Termination: Wraparound; Series: CL; Construction: Flat; Length: 0.063inch; Width: 0.031inch; Thickness: 0.035inch; Lead Free: Lead Free; RoHS Compliant: Yes; ComponentLink1URL: https://datasheet.ciiva.com/25766/cl10a106ma8nrnc-25766562.pdf?src-supplier=Digi-Key; ComponentLink1Description: https://datasheet.ciiva.com/25766/cl10a106ma8nrnc-25766562.pdf?src-supplier=Digi-Key; Supplier Part Number 1: CL10A106MA8NRNC; LCSC Part Number: C96446
J1 = 4 Pin SMD Wire Connector: Wire Connecting Pads; Item Type: SMD Pads; Manufacturer Part Number: 4 Pin SMD Wire Connector
J2 = SEMG PAD: Sensor Connecting Pads
J3 = Test Pad SMD 3 Pin: Test Pad
LED1 = 19-217/S2C-AQ1R1B/3T: 0603(H=0.4mm) λD=600.5~612.5nm VR=5V VF=1.7V~2.2V IF=25mA PD=60mW; Manufacturer: Everlight; Item Type: LED; Supplier 1: Digi-Key; Manufacturer Part Number: 19-217/S2C-AQ1R1B/3T; RoHS: No; Category: LEDs; Supplier Part Number 1: 1080-19-217/S2C-AQ1R1B/3TTR-ND; LCSC Part Number: C146215; ComponentLink1Description: LCSC; ComponentLink1URL: https://www.lcsc.com/product-detail/Light-Emitting-Diodes-LED_Everlight-Elec-19-217-S2C-AQ1R1B-3T_C146215.html
R1 = RC0402FR-07240RL: RES 240 OHM 1% 1/16W 0402; Manufacturer: Yageo; Power Rating: 63mW; Temperature Coefficient: 100ppm/°C; Voltage Rating (DC): 50V; Supplier 1: Mouser; Manufacturer Part Number: RC0402FR-07240RL; RoHS: Yes; Category: Chip SMD Resistors; Stock 1: 1903202; Pricing 1: 1=0.10000, 10=0.01200, 50=0.01200, 100=0.00500, 1000=0.00300, 10000=0.00100 (USD); Case/Package: 0402; Case Code (Metric): 1005; Case Code (Imperial): 0402; Size Code: 0402; Min Operating Temperature: -55°C; Max Operating Temperature: 155°C; Resistance: 240R; Tolerance: 1%; Packaging: Tape and Reel; Resistor Type: Thick Film; Voltage Rating: 50V; Package Quantity: 1; Number of Terminations: 2; Termination: SMD/SMT; Max Power Dissipation: 63mW; Features: Moisture Resistant; Series: RC; Construction: Rectangular; Resistance Tolerance: 1%; Length: 1mm; Width: 0.02inch; Height: 0.016inch; Depth: 0.5mm; REACH SVHC: Unknown; Lead Free: Lead Free; RoHS Compliant: Yes; Military Standard: Not; ComponentLink1URL: https://datasheet.ciiva.com/7849/1018594-7849915.pdf?src-supplier=Element14; ComponentLink1Description: https://datasheet.ciiva.com/7849/1018594-7849915.pdf?src-supplier=Element14; ComponentLink2URL: https://datasheet.ciiva.com/7849/1018594-7849916.pdf?src-supplier=Element14; ComponentLink2Description: https://datasheet.ciiva.com/7849/1018594-7849916.pdf?src-supplier=Element14; ComponentLink3URL: https://datasheet.ciiva.com/2519/pyu-r-int-thick-7-2519157.pdf?src-supplier=Digi-Key; ComponentLink3Description: https://datasheet.ciiva.com/2519/pyu-r-int-thick-7-2519157.pdf?src-supplier=Digi-Key; ComponentLink4URL: https://datasheet.ciiva.com/2519/pyu-r-int-thick-7-2519158.pdf?src-supplier=Digi-Key; ComponentLink4Description: https://datasheet.ciiva.com/2519/pyu-r-int-thick-7-2519158.pdf?src-supplier=Digi-Key; ComponentLink5URL: https://datasheet.ciiva.com/2519/pyu-r-int-thick-7-2519156.pdf?src-supplier=Digi-Key; ComponentLink5Description: https://datasheet.ciiva.com/2519/pyu-r-int-thick-7-2519156.pdf?src-supplier=Digi-Key; ComponentLink6URL: https://datasheet.ciiva.com/12669/pyu-rc0402-51-rohs-l-6-r-12669689.pdf?src-supplier=Mouser; ComponentLink6Description: https://datasheet.ciiva.com/12669/pyu-rc0402-51-rohs-l-6-r-12669689.pdf?src-supplier=Mouser; ComponentLink7URL: https://datasheet.ciiva.com/17419/pyu-rc0402-51-rohs-l-6-r-17419482.pdf?src-supplier=Future+Electronics; ComponentLink7Description: https://datasheet.ciiva.com/17419/pyu-rc0402-51-rohs-l-6-r-17419482.pdf?src-supplier=Future+Electronics; Supplier Part Number 1: 603-RC0402FR-07240RL
R2 = RC0402JR-071KL: RES 1K OHM 5% 1/16W 0402; Manufacturer: Yageo; Resistance: 1kR; Power Rating: 62.5mW; Voltage Rating: 50V; Temperature Coefficient: 100ppm/°C; Max Power Dissipation: 63mW; Item Type: Resistor; Supplier 1: Digi-Key; Manufacturer Part Number: RC0402JR-071KL; RoHS: Yes; Category: Chip SMD Resistors; Stock 1: 452315; Pricing 1: 1=0.10000, 10=0.01300, 100=0.00540, 1000=0.00244, 2500=0.00212, 5000=0.00175 (USD); Case/Package: 0402; Case Code (Imperial): 0402; Case Code (Metric): 1005; Size Code: 0402; Min Operating Temperature: -55°C; Max Operating Temperature: 155°C; Tolerance: 5%; Packaging: Tape and Reel; Package Quantity: 1; Termination: SMD/SMT; Resistor Type: Thick Film; Number of Terminations: 2; Features: Moisture Resistant; Series: RC; Resistance Tolerance: 5%; Construction: Rectangular; Length: 0.039inch; Width: 0.02inch; Height: 0.016inch; Depth: 0.5mm; REACH SVHC: No SVHC; Military Standard: Not; Lead Free: Lead Free; RoHS Compliant: Yes; ComponentLink1URL: https://datasheet.ciiva.com/7983/1018594-7983558.pdf?src-supplier=Element14; ComponentLink1Description: https://datasheet.ciiva.com/7983/1018594-7983558.pdf?src-supplier=Element14; ComponentLink2URL: https://datasheet.ciiva.com/2452/pyu-r-int-thick-7-2452756.pdf?src-supplier=Digi-Key; ComponentLink2Description: https://datasheet.ciiva.com/2452/pyu-r-int-thick-7-2452756.pdf?src-supplier=Digi-Key; ComponentLink3URL: https://datasheet.ciiva.com/2452/pyu-r-int-thick-7-2452757.pdf?src-supplier=Digi-Key; ComponentLink3Description: https://datasheet.ciiva.com/2452/pyu-r-int-thick-7-2452757.pdf?src-supplier=Digi-Key; ComponentLink4URL: https://datasheet.ciiva.com/2452/pyu-r-int-thick-7-2452755.pdf?src-supplier=Digi-Key; ComponentLink4Description: https://datasheet.ciiva.com/2452/pyu-r-int-thick-7-2452755.pdf?src-supplier=Digi-Key; ComponentLink5URL: https://datasheet.ciiva.com/7850/1018594-7850170.pdf?src-supplier=Element14; ComponentLink5Description: https://datasheet.ciiva.com/7850/1018594-7850170.pdf?src-supplier=Element14; ComponentLink6URL: https://datasheet.ciiva.com/7850/1018594-7850171.pdf?src-supplier=Element14; ComponentLink6Description: https://datasheet.ciiva.com/7850/1018594-7850171.pdf?src-supplier=Element14; ComponentLink7URL: https://datasheet.ciiva.com/17081/pyu-rc0402-51-rohs-l-6-r-17081438.pdf?src-supplier=Future+Electronics; ComponentLink7Description: https://datasheet.ciiva.com/17081/pyu-rc0402-51-rohs-l-6-r-17081438.pdf?src-supplier=Future+Electronics; Supplier Part Number 1: 311-1.0KJRCT-ND; LCSC Part Number: C105637
R3 R4 = RC0402JR-07150KL: RES SMD 0402 150kOhm 5% Paper T/R; Manufacturer: Yageo; Resistance: 150kR; Power Rating: 63mW; Voltage Rating: 50V; Temperature Coefficient: 100ppm/°C; Item Type: Resistor; Supplier 1: Arrow Electronics; Manufacturer Part Number: RC0402JR-07150KL; RoHS: Yes; Category: Chip SMD Resistors; Stock 1: 170000; Pricing 1: 10000=0.00100 (USD); Case/Package: 0402; Case Code (Metric): 1005; Case Code (Imperial): 0402; Weight: 2.3E-05oz; Size Code: 0402; Min Operating Temperature: -55°C; Max Operating Temperature: 155°C; Package Quantity: 1; Tolerance: 5%; Packaging: Tape and Reel; Resistor Type: Thick Film; Number of Terminations: 2; Termination: SMD/SMT; Max Power Dissipation: 63mW; Features: Moisture Resistant; Series: RC; Construction: Rectangular; Resistance Tolerance: 5%; Length: 1mm; Width: 0.02inch; Height: 0.016inch; Depth: 0.5mm; REACH SVHC: No SVHC; Military Standard: Not; Lead Free: Lead Free; RoHS Compliant: Yes; ComponentLink1URL: https://datasheet.ciiva.com/7983/1018594-7983551.pdf?src-supplier=Element14; ComponentLink1Description: https://datasheet.ciiva.com/7983/1018594-7983551.pdf?src-supplier=Element14; ComponentLink2URL: https://datasheet.ciiva.com/2518/pyu-r-int-thick-7-2518929.pdf?src-supplier=Digi-Key; ComponentLink2Description: https://datasheet.ciiva.com/2518/pyu-r-int-thick-7-2518929.pdf?src-supplier=Digi-Key; ComponentLink3URL: https://datasheet.ciiva.com/2518/pyu-r-int-thick-7-2518930.pdf?src-supplier=Digi-Key; ComponentLink3Description: https://datasheet.ciiva.com/2518/pyu-r-int-thick-7-2518930.pdf?src-supplier=Digi-Key; ComponentLink4URL: https://datasheet.ciiva.com/2518/pyu-r-int-thick-7-2518928.pdf?src-supplier=Digi-Key; ComponentLink4Description: https://datasheet.ciiva.com/2518/pyu-r-int-thick-7-2518928.pdf?src-supplier=Digi-Key; ComponentLink5URL: https://datasheet.ciiva.com/7850/1018594-7850149.pdf?src-supplier=Element14; ComponentLink5Description: https://datasheet.ciiva.com/7850/1018594-7850149.pdf?src-supplier=Element14; ComponentLink6URL: https://datasheet.ciiva.com/17072/pyu-rc0402-51-rohs-l-6-r-17072379.pdf?src-supplier=Future+Electronics; ComponentLink6Description: https://datasheet.ciiva.com/17072/pyu-rc0402-51-rohs-l-6-r-17072379.pdf?src-supplier=Future+Electronics; ComponentLink7URL: https://datasheet.ciiva.com/15189/getdatasheetpartid-251830-15189543.pdf?src-supplier=Verical; ComponentLink7Description: https://datasheet.ciiva.com/15189/getdatasheetpartid-251830-15189543.pdf?src-supplier=Verical; Supplier Part Number 1: RC0402JR-07150KL; LCSC Part Number: C137919
SB101-SB112 = Solder Bridge 0402: Solder Bridge ON; Manufacturer Part Number: Solder Bridge 0402; Item Type: Solder Bridge
U1 = AD8221ARZ-R7: IC OPAMP INSTR 825KHZ 8SOIC; Manufacturer: Analog Devices; Number of Channels: 1; Common Mode Rejection Ratio: 80dB; Min Dual Supply Voltage: 2.3V; Max Dual Supply Voltage: 18V; Slew Rate: 2.5V/µs; Nominal Supply Current: 1mA; Max Power Dissipation: 200mW; Bandwidth: 562kHz; Input Bias Current: 1.5nA; Input Offset Voltage (Vos): 60uV; Output Current per Channel: 18mA; Power Supply Rejection Ratio (PSRR): 130dB; Voltage Gain: 60dB; Input Resistance: 100GR; Quiescent Current: 900uA; Operating Supply Voltage: 36V; Supplier 1: Mouser; Manufacturer Part Number: AD8221ARZ-R7; RoHS: Yes; Category: Amplifiers - Op Amps, Buffer, Instrumentation; Pricing 1: 1=7.37000, 10=6.66000, 25=6.35000, 50=6.35000, 100=5.51000, 250=5.27000, 500=4.80000, 1000=4.37000, 10000=4.37000 (USD); Case/Package: SOIC; Number of Pins: 8; Contact Plating: Tin,Matte; Min Operating Temperature: -40°C; Max Operating Temperature: 85°C; -3db Bandwidth: 825kHz; Package Quantity: 1000; Packaging: Tape and Reel; Number of Circuits: 1; Operating Supply Current: 1mA; Number of Elements: 1; Power Dissipation: 200mW; Series: -; Supply Current: 1mA; Radiation Hardening: No; Lead Free: Contains Lead; RoHS Compliant: Yes; ComponentLink1URL: https://datasheet.ciiva.com/15128/getdatasheetpartid-313520-15128733.pdf?src-supplier=Verical; ComponentLink1Description: https://datasheet.ciiva.com/15128/getdatasheetpartid-313520-15128733.pdf?src-supplier=Verical; ComponentLink2URL: https://datasheet.ciiva.com/2975/ad8221-2975658.pdf?src-supplier=Avnet; ComponentLink2Description: https://datasheet.ciiva.com/2975/ad8221-2975658.pdf?src-supplier=Avnet; ComponentLink3URL: https://datasheet.ciiva.com/2975/ad8221-2975980.pdf?src-supplier=Avnet; ComponentLink3Description: https://datasheet.ciiva.com/2975/ad8221-2975980.pdf?src-supplier=Avnet; ComponentLink4URL: https://datasheet.ciiva.com/6628/ad8221-6628618.pdf?src-supplier=Digi-Key; ComponentLink4Description: https://datasheet.ciiva.com/6628/ad8221-6628618.pdf?src-supplier=Digi-Key; ComponentLink5URL: https://datasheet.ciiva.com/6628/ad8221-6628619.pdf?src-supplier=Digi-Key; ComponentLink5Description: https://datasheet.ciiva.com/6628/ad8221-6628619.pdf?src-supplier=Digi-Key; ComponentLink6URL: https://datasheet.ciiva.com/6628/ad8221-6628617.pdf?src-supplier=Digi-Key; ComponentLink6Description: https://datasheet.ciiva.com/6628/ad8221-6628617.pdf?src-supplier=Digi-Key; ComponentLink7URL: https://datasheet.ciiva.com/48709/001249009-da-01-en-ic-amp-inst-prec-ad8221arz-r7-soic-8-adi-48709526.pdf?src-supplier=Conrad; ComponentLink7Description: https://datasheet.ciiva.com/48709/001249009-da-01-en-ic-amp-inst-prec-ad8221arz-r7-soic-8-adi-48709526.pdf?src-supplier=Conrad; Supplier Part Number 1: 584-AD8221ARZ-R7; LCSC Part Number: C13342; Item Type: IC
U2 = SGM3207YN5G/TR: as U3 on sheet Opamp_Sheet; Supplier 1: Avnet; Manufacturer Part Number: SGM3207YN5G/TR; RoHS: No; Category: Uncategorized; Pricing 1: 3000=0.38750, 6000=0.36250, 12000=0.33750, 18000=0.32500, 24000=0.31250, 30000=0.31250, 300000=0.30500 (USD); LCSC Part Number: C80403; Supplier Part Number 1: SGM3207YN5G/TR